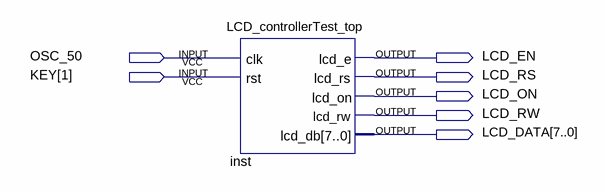
[diagram p0: schematic sheet]
// Quartus schematic LCD_cont_test.bdf as structural Verilog: 1 symbols, 7 pins
module LCD_cont_test (
  input  OSC_50,
  input  [1:1] KEY,
  output LCD_EN,
  output LCD_RS,
  output LCD_ON,
  output LCD_RW,
  output [7:0] LCD_DATA
);

  LCD_controllerTest_top inst (
    .clk(OSC_50), .rst(KEY[1]), .lcd_e(LCD_EN), .lcd_rs(LCD_RS), .lcd_on(LCD_ON), .lcd_rw(LCD_RW),
    .lcd_db(LCD_DATA));
endmodule
